# Altium schematic sheet 850nm-LED-Sheet.SchDoc
size 420 x 297 mm; SheetNumber: 5; SheetTotal: 6
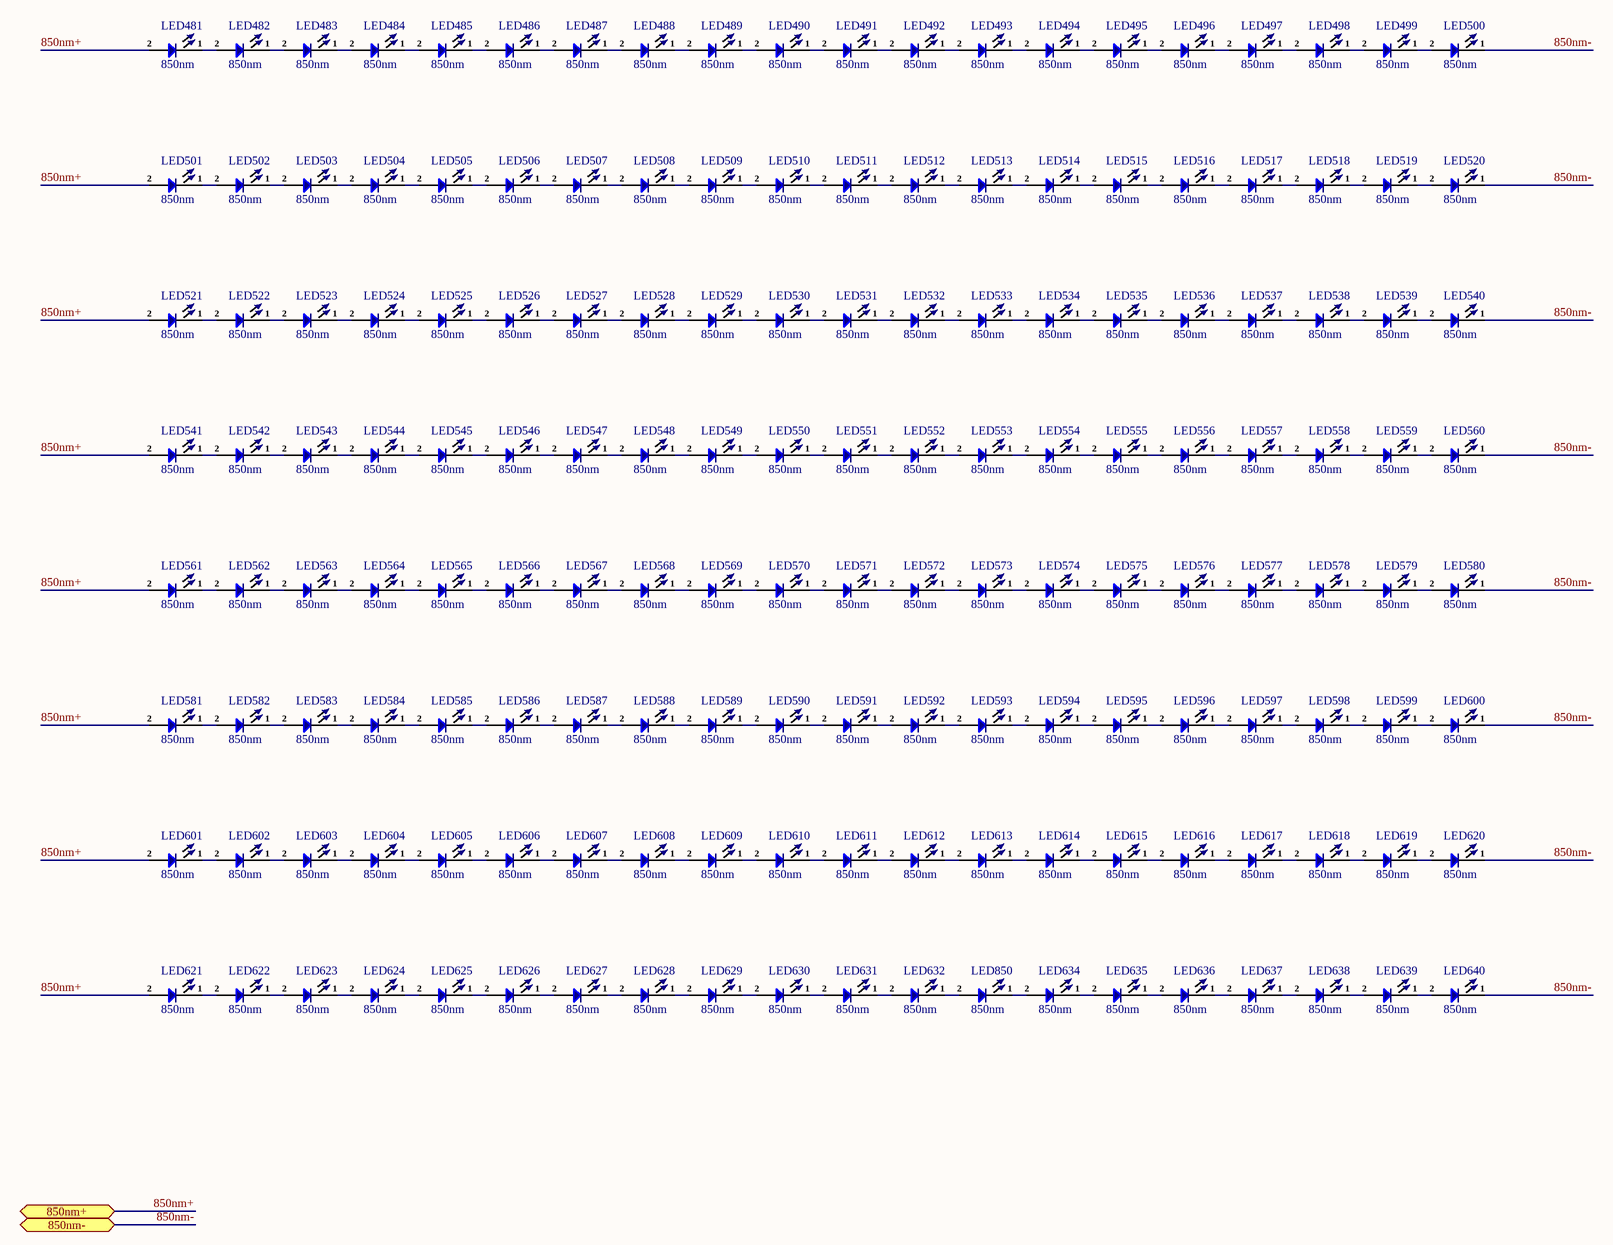
[diagram p0: 850nm-LED-Sheet.SchDoc]

## Parts
LED481  850nm  [TH LED 3mm_]
LED482  850nm  [TH LED 3mm_]
LED483  850nm  [TH LED 3mm_]
LED484  850nm  [TH LED 3mm_]
LED485  850nm  [TH LED 3mm_]
LED486  850nm  [TH LED 3mm_]
LED487  850nm  [TH LED 3mm_]
LED488  850nm  [TH LED 3mm_]
LED489  850nm  [TH LED 3mm_]
LED490  850nm  [TH LED 3mm_]
LED491  850nm  [TH LED 3mm_]
LED492  850nm  [TH LED 3mm_]
LED493  850nm  [TH LED 3mm_]
LED494  850nm  [TH LED 3mm_]
LED495  850nm  [TH LED 3mm_]
LED496  850nm  [TH LED 3mm_]
LED497  850nm  [TH LED 3mm_]
LED498  850nm  [TH LED 3mm_]
LED499  850nm  [TH LED 3mm_]
LED500  850nm  [TH LED 3mm_]
LED501  850nm  [TH LED 3mm_]
LED502  850nm  [TH LED 3mm_]
LED503  850nm  [TH LED 3mm_]
LED504  850nm  [TH LED 3mm_]
LED505  850nm  [TH LED 3mm_]
LED506  850nm  [TH LED 3mm_]
LED507  850nm  [TH LED 3mm_]
LED508  850nm  [TH LED 3mm_]
LED509  850nm  [TH LED 3mm_]
LED510  850nm  [TH LED 3mm_]
LED511  850nm  [TH LED 3mm_]
LED512  850nm  [TH LED 3mm_]
LED513  850nm  [TH LED 3mm_]
LED514  850nm  [TH LED 3mm_]
LED515  850nm  [TH LED 3mm_]
LED516  850nm  [TH LED 3mm_]
LED517  850nm  [TH LED 3mm_]
LED518  850nm  [TH LED 3mm_]
LED519  850nm  [TH LED 3mm_]
LED520  850nm  [TH LED 3mm_]
LED521  850nm  [TH LED 3mm_]
LED522  850nm  [TH LED 3mm_]
LED523  850nm  [TH LED 3mm_]
LED524  850nm  [TH LED 3mm_]
LED525  850nm  [TH LED 3mm_]
LED526  850nm  [TH LED 3mm_]
LED527  850nm  [TH LED 3mm_]
LED528  850nm  [TH LED 3mm_]
LED529  850nm  [TH LED 3mm_]
LED530  850nm  [TH LED 3mm_]
LED531  850nm  [TH LED 3mm_]
LED532  850nm  [TH LED 3mm_]
LED533  850nm  [TH LED 3mm_]
LED534  850nm  [TH LED 3mm_]
LED535  850nm  [TH LED 3mm_]
LED536  850nm  [TH LED 3mm_]
LED537  850nm  [TH LED 3mm_]
LED538  850nm  [TH LED 3mm_]
LED539  850nm  [TH LED 3mm_]
LED540  850nm  [TH LED 3mm_]
LED541  850nm  [TH LED 3mm_]
LED542  850nm  [TH LED 3mm_]
LED543  850nm  [TH LED 3mm_]
LED544  850nm  [TH LED 3mm_]
LED545  850nm  [TH LED 3mm_]
LED546  850nm  [TH LED 3mm_]
LED547  850nm  [TH LED 3mm_]
LED548  850nm  [TH LED 3mm_]
LED549  850nm  [TH LED 3mm_]
LED550  850nm  [TH LED 3mm_]
LED551  850nm  [TH LED 3mm_]
LED552  850nm  [TH LED 3mm_]
LED553  850nm  [TH LED 3mm_]
LED554  850nm  [TH LED 3mm_]
LED555  850nm  [TH LED 3mm_]
LED556  850nm  [TH LED 3mm_]
LED557  850nm  [TH LED 3mm_]
LED558  850nm  [TH LED 3mm_]
LED559  850nm  [TH LED 3mm_]
LED560  850nm  [TH LED 3mm_]
LED561  850nm  [TH LED 3mm_]
LED562  850nm  [TH LED 3mm_]
LED563  850nm  [TH LED 3mm_]
LED564  850nm  [TH LED 3mm_]
LED565  850nm  [TH LED 3mm_]
LED566  850nm  [TH LED 3mm_]
LED567  850nm  [TH LED 3mm_]
LED568  850nm  [TH LED 3mm_]
LED569  850nm  [TH LED 3mm_]
LED570  850nm  [TH LED 3mm_]
LED571  850nm  [TH LED 3mm_]
LED572  850nm  [TH LED 3mm_]
LED573  850nm  [TH LED 3mm_]
LED574  850nm  [TH LED 3mm_]
LED575  850nm  [TH LED 3mm_]
LED576  850nm  [TH LED 3mm_]
LED577  850nm  [TH LED 3mm_]
LED578  850nm  [TH LED 3mm_]
LED579  850nm  [TH LED 3mm_]
LED580  850nm  [TH LED 3mm_]
LED581  850nm  [TH LED 3mm_]
LED582  850nm  [TH LED 3mm_]
LED583  850nm  [TH LED 3mm_]
LED584  850nm  [TH LED 3mm_]
LED585  850nm  [TH LED 3mm_]
LED586  850nm  [TH LED 3mm_]
LED587  850nm  [TH LED 3mm_]
LED588  850nm  [TH LED 3mm_]
LED589  850nm  [TH LED 3mm_]
LED590  850nm  [TH LED 3mm_]
LED591  850nm  [TH LED 3mm_]
LED592  850nm  [TH LED 3mm_]
LED593  850nm  [TH LED 3mm_]
LED594  850nm  [TH LED 3mm_]
LED595  850nm  [TH LED 3mm_]
LED596  850nm  [TH LED 3mm_]
LED597  850nm  [TH LED 3mm_]
LED598  850nm  [TH LED 3mm_]
LED599  850nm  [TH LED 3mm_]
LED600  850nm  [TH LED 3mm_]
LED601  850nm  [TH LED 3mm_]
LED602  850nm  [TH LED 3mm_]
LED603  850nm  [TH LED 3mm_]
LED604  850nm  [TH LED 3mm_]
LED605  850nm  [TH LED 3mm_]
LED606  850nm  [TH LED 3mm_]
LED607  850nm  [TH LED 3mm_]
LED608  850nm  [TH LED 3mm_]
LED609  850nm  [TH LED 3mm_]
LED610  850nm  [TH LED 3mm_]
LED611  850nm  [TH LED 3mm_]
LED612  850nm  [TH LED 3mm_]
LED613  850nm  [TH LED 3mm_]
LED614  850nm  [TH LED 3mm_]
LED615  850nm  [TH LED 3mm_]
LED616  850nm  [TH LED 3mm_]
LED617  850nm  [TH LED 3mm_]
LED618  850nm  [TH LED 3mm_]
LED619  850nm  [TH LED 3mm_]
LED620  850nm  [TH LED 3mm_]
LED621  850nm  [TH LED 3mm_]
LED622  850nm  [TH LED 3mm_]
LED623  850nm  [TH LED 3mm_]
LED624  850nm  [TH LED 3mm_]
LED625  850nm  [TH LED 3mm_]
LED626  850nm  [TH LED 3mm_]
LED627  850nm  [TH LED 3mm_]
LED628  850nm  [TH LED 3mm_]
LED629  850nm  [TH LED 3mm_]
LED630  850nm  [TH LED 3mm_]
LED631  850nm  [TH LED 3mm_]
LED632  850nm  [TH LED 3mm_]
LED634  850nm  [TH LED 3mm_]
LED635  850nm  [TH LED 3mm_]
LED636  850nm  [TH LED 3mm_]
LED637  850nm  [TH LED 3mm_]
LED638  850nm  [TH LED 3mm_]
LED639  850nm  [TH LED 3mm_]
LED640  850nm  [TH LED 3mm_]
LED850  850nm  [TH LED 3mm_]

## Ports
850nm+ (bidir, see Main-Sheet[4B]), 850nm- (bidir, see Main-Sheet[4B])

## Nets
850nm+: LED481.2 LED501.2 LED521.2 LED541.2 LED561.2 LED581.2 LED601.2 LED621.2 ; port 850nm+
850nm-: LED500.1 LED520.1 LED540.1 LED560.1 LED580.1 LED600.1 LED620.1 LED640.1 ; port 850nm-
NetLED481_1: LED481.1 LED482.2
NetLED482_1: LED482.1 LED483.2
NetLED483_1: LED483.1 LED484.2
NetLED484_1: LED484.1 LED485.2
NetLED485_1: LED485.1 LED486.2
NetLED486_1: LED486.1 LED487.2
NetLED487_1: LED487.1 LED488.2
NetLED488_1: LED488.1 LED489.2
NetLED489_1: LED489.1 LED490.2
NetLED490_1: LED490.1 LED491.2
NetLED491_1: LED491.1 LED492.2
NetLED492_1: LED492.1 LED493.2
NetLED493_1: LED493.1 LED494.2
NetLED494_1: LED494.1 LED495.2
NetLED495_1: LED495.1 LED496.2
NetLED496_1: LED496.1 LED497.2
NetLED497_1: LED497.1 LED498.2
NetLED498_1: LED498.1 LED499.2
NetLED499_1: LED499.1 LED500.2
NetLED501_1: LED501.1 LED502.2
NetLED502_1: LED502.1 LED503.2
NetLED503_1: LED503.1 LED504.2
NetLED504_1: LED504.1 LED505.2
NetLED505_1: LED505.1 LED506.2
NetLED506_1: LED506.1 LED507.2
NetLED507_1: LED507.1 LED508.2
NetLED508_1: LED508.1 LED509.2
NetLED509_1: LED509.1 LED510.2
NetLED510_1: LED510.1 LED511.2
NetLED511_1: LED511.1 LED512.2
NetLED512_1: LED512.1 LED513.2
NetLED513_1: LED513.1 LED514.2
NetLED514_1: LED514.1 LED515.2
NetLED515_1: LED515.1 LED516.2
NetLED516_1: LED516.1 LED517.2
NetLED517_1: LED517.1 LED518.2
NetLED518_1: LED518.1 LED519.2
NetLED519_1: LED519.1 LED520.2
NetLED521_1: LED521.1 LED522.2
NetLED522_1: LED522.1 LED523.2
NetLED523_1: LED523.1 LED524.2
NetLED524_1: LED524.1 LED525.2
NetLED525_1: LED525.1 LED526.2
NetLED526_1: LED526.1 LED527.2
NetLED527_1: LED527.1 LED528.2
NetLED528_1: LED528.1 LED529.2
NetLED529_1: LED529.1 LED530.2
NetLED530_1: LED530.1 LED531.2
NetLED531_1: LED531.1 LED532.2
NetLED532_1: LED532.1 LED533.2
NetLED533_1: LED533.1 LED534.2
NetLED534_1: LED534.1 LED535.2
NetLED535_1: LED535.1 LED536.2
NetLED536_1: LED536.1 LED537.2
NetLED537_1: LED537.1 LED538.2
NetLED538_1: LED538.1 LED539.2
NetLED539_1: LED539.1 LED540.2
NetLED541_1: LED541.1 LED542.2
NetLED542_1: LED542.1 LED543.2
NetLED543_1: LED543.1 LED544.2
NetLED544_1: LED544.1 LED545.2
NetLED545_1: LED545.1 LED546.2
NetLED546_1: LED546.1 LED547.2
NetLED547_1: LED547.1 LED548.2
NetLED548_1: LED548.1 LED549.2
NetLED549_1: LED549.1 LED550.2
NetLED550_1: LED550.1 LED551.2
NetLED551_1: LED551.1 LED552.2
NetLED552_1: LED552.1 LED553.2
NetLED553_1: LED553.1 LED554.2
NetLED554_1: LED554.1 LED555.2
NetLED555_1: LED555.1 LED556.2
NetLED556_1: LED556.1 LED557.2
NetLED557_1: LED557.1 LED558.2
NetLED558_1: LED558.1 LED559.2
NetLED559_1: LED559.1 LED560.2
NetLED561_1: LED561.1 LED562.2
NetLED562_1: LED562.1 LED563.2
NetLED563_1: LED563.1 LED564.2
NetLED564_1: LED564.1 LED565.2
NetLED565_1: LED565.1 LED566.2
NetLED566_1: LED566.1 LED567.2
NetLED567_1: LED567.1 LED568.2
NetLED568_1: LED568.1 LED569.2
NetLED569_1: LED569.1 LED570.2
NetLED570_1: LED570.1 LED571.2
NetLED571_1: LED571.1 LED572.2
NetLED572_1: LED572.1 LED573.2
NetLED573_1: LED573.1 LED574.2
NetLED574_1: LED574.1 LED575.2
NetLED575_1: LED575.1 LED576.2
NetLED576_1: LED576.1 LED577.2
NetLED577_1: LED577.1 LED578.2
NetLED578_1: LED578.1 LED579.2
NetLED579_1: LED579.1 LED580.2
NetLED581_1: LED581.1 LED582.2
NetLED582_1: LED582.1 LED583.2
NetLED583_1: LED583.1 LED584.2
NetLED584_1: LED584.1 LED585.2
NetLED585_1: LED585.1 LED586.2
NetLED586_1: LED586.1 LED587.2
NetLED587_1: LED587.1 LED588.2
NetLED588_1: LED588.1 LED589.2
NetLED589_1: LED589.1 LED590.2
NetLED590_1: LED590.1 LED591.2
NetLED591_1: LED591.1 LED592.2
NetLED592_1: LED592.1 LED593.2
NetLED593_1: LED593.1 LED594.2
NetLED594_1: LED594.1 LED595.2
NetLED595_1: LED595.1 LED596.2
NetLED596_1: LED596.1 LED597.2
NetLED597_1: LED597.1 LED598.2
NetLED598_1: LED598.1 LED599.2
NetLED599_1: LED599.1 LED600.2
NetLED601_1: LED601.1 LED602.2
NetLED602_1: LED602.1 LED603.2
NetLED603_1: LED603.1 LED604.2
NetLED604_1: LED604.1 LED605.2
NetLED605_1: LED605.1 LED606.2
NetLED606_1: LED606.1 LED607.2
NetLED607_1: LED607.1 LED608.2
NetLED608_1: LED608.1 LED609.2
NetLED609_1: LED609.1 LED610.2
NetLED610_1: LED610.1 LED611.2
NetLED611_1: LED611.1 LED612.2
NetLED612_1: LED612.1 LED613.2
NetLED613_1: LED613.1 LED614.2
NetLED614_1: LED614.1 LED615.2
NetLED615_1: LED615.1 LED616.2
NetLED616_1: LED616.1 LED617.2
NetLED617_1: LED617.1 LED618.2
NetLED618_1: LED618.1 LED619.2
NetLED619_1: LED619.1 LED620.2
NetLED621_1: LED621.1 LED622.2
NetLED622_1: LED622.1 LED623.2
NetLED623_1: LED623.1 LED624.2
NetLED624_1: LED624.1 LED625.2
NetLED625_1: LED625.1 LED626.2
NetLED626_1: LED626.1 LED627.2
NetLED627_1: LED627.1 LED628.2
NetLED628_1: LED628.1 LED629.2
NetLED629_1: LED629.1 LED630.2
NetLED630_1: LED630.1 LED631.2
NetLED631_1: LED631.1 LED632.2
NetLED632_1: LED632.1 LED850.2
NetLED634_1: LED634.1 LED635.2
NetLED634_2: LED634.2 LED850.1
NetLED635_1: LED635.1 LED636.2
NetLED636_1: LED636.1 LED637.2
NetLED637_1: LED637.1 LED638.2
NetLED638_1: LED638.1 LED639.2
NetLED639_1: LED639.1 LED640.2

## Notes on the sheet
- File:
- Title:
- Date:
- Page
- Num:
- Total:
- Drawn By: Huzaifa Ali

## Library data of the parts
LED481-LED632 LED634-LED640 LED850 = IR LED 3mm: IR Led 3mm Through; ComponentLink1Description: Aliexpress; ComponentLink1URL: https://nl.aliexpress.com/item/32950109432.html?spm=a2g0o.productlist.0.0.2d9749ecxdTGvK&algo_pvid=f3c88197-d0dd-4360-badc-ef5a9d1d435b&algo_exp_id=f3c88197-d0dd-4360-badc-ef5a9d1d435b-1&pdp_ext_f=%7B%22sku_id%22%3A%2266309321327%22%7D